# EasyEDA Pro project H7MS-native-official-library-audit-20261017.epro, schematic H7MS_CORE_H735_A1_核心板原理图, sheets 1 to 4 of 8

## Sheets
1 C01A_H735主控与信号分配: Assembly Variant: Basic; Board Name: Board1; Create Date: 2026-08-30; Page Name: P1; Project Name: H7MS-Core-A1; Schematic Name: Schematic1; Update Date: 2026-08-30; Company: 嘉立创EDA; Page Size: A3; Version: Draft_0.10
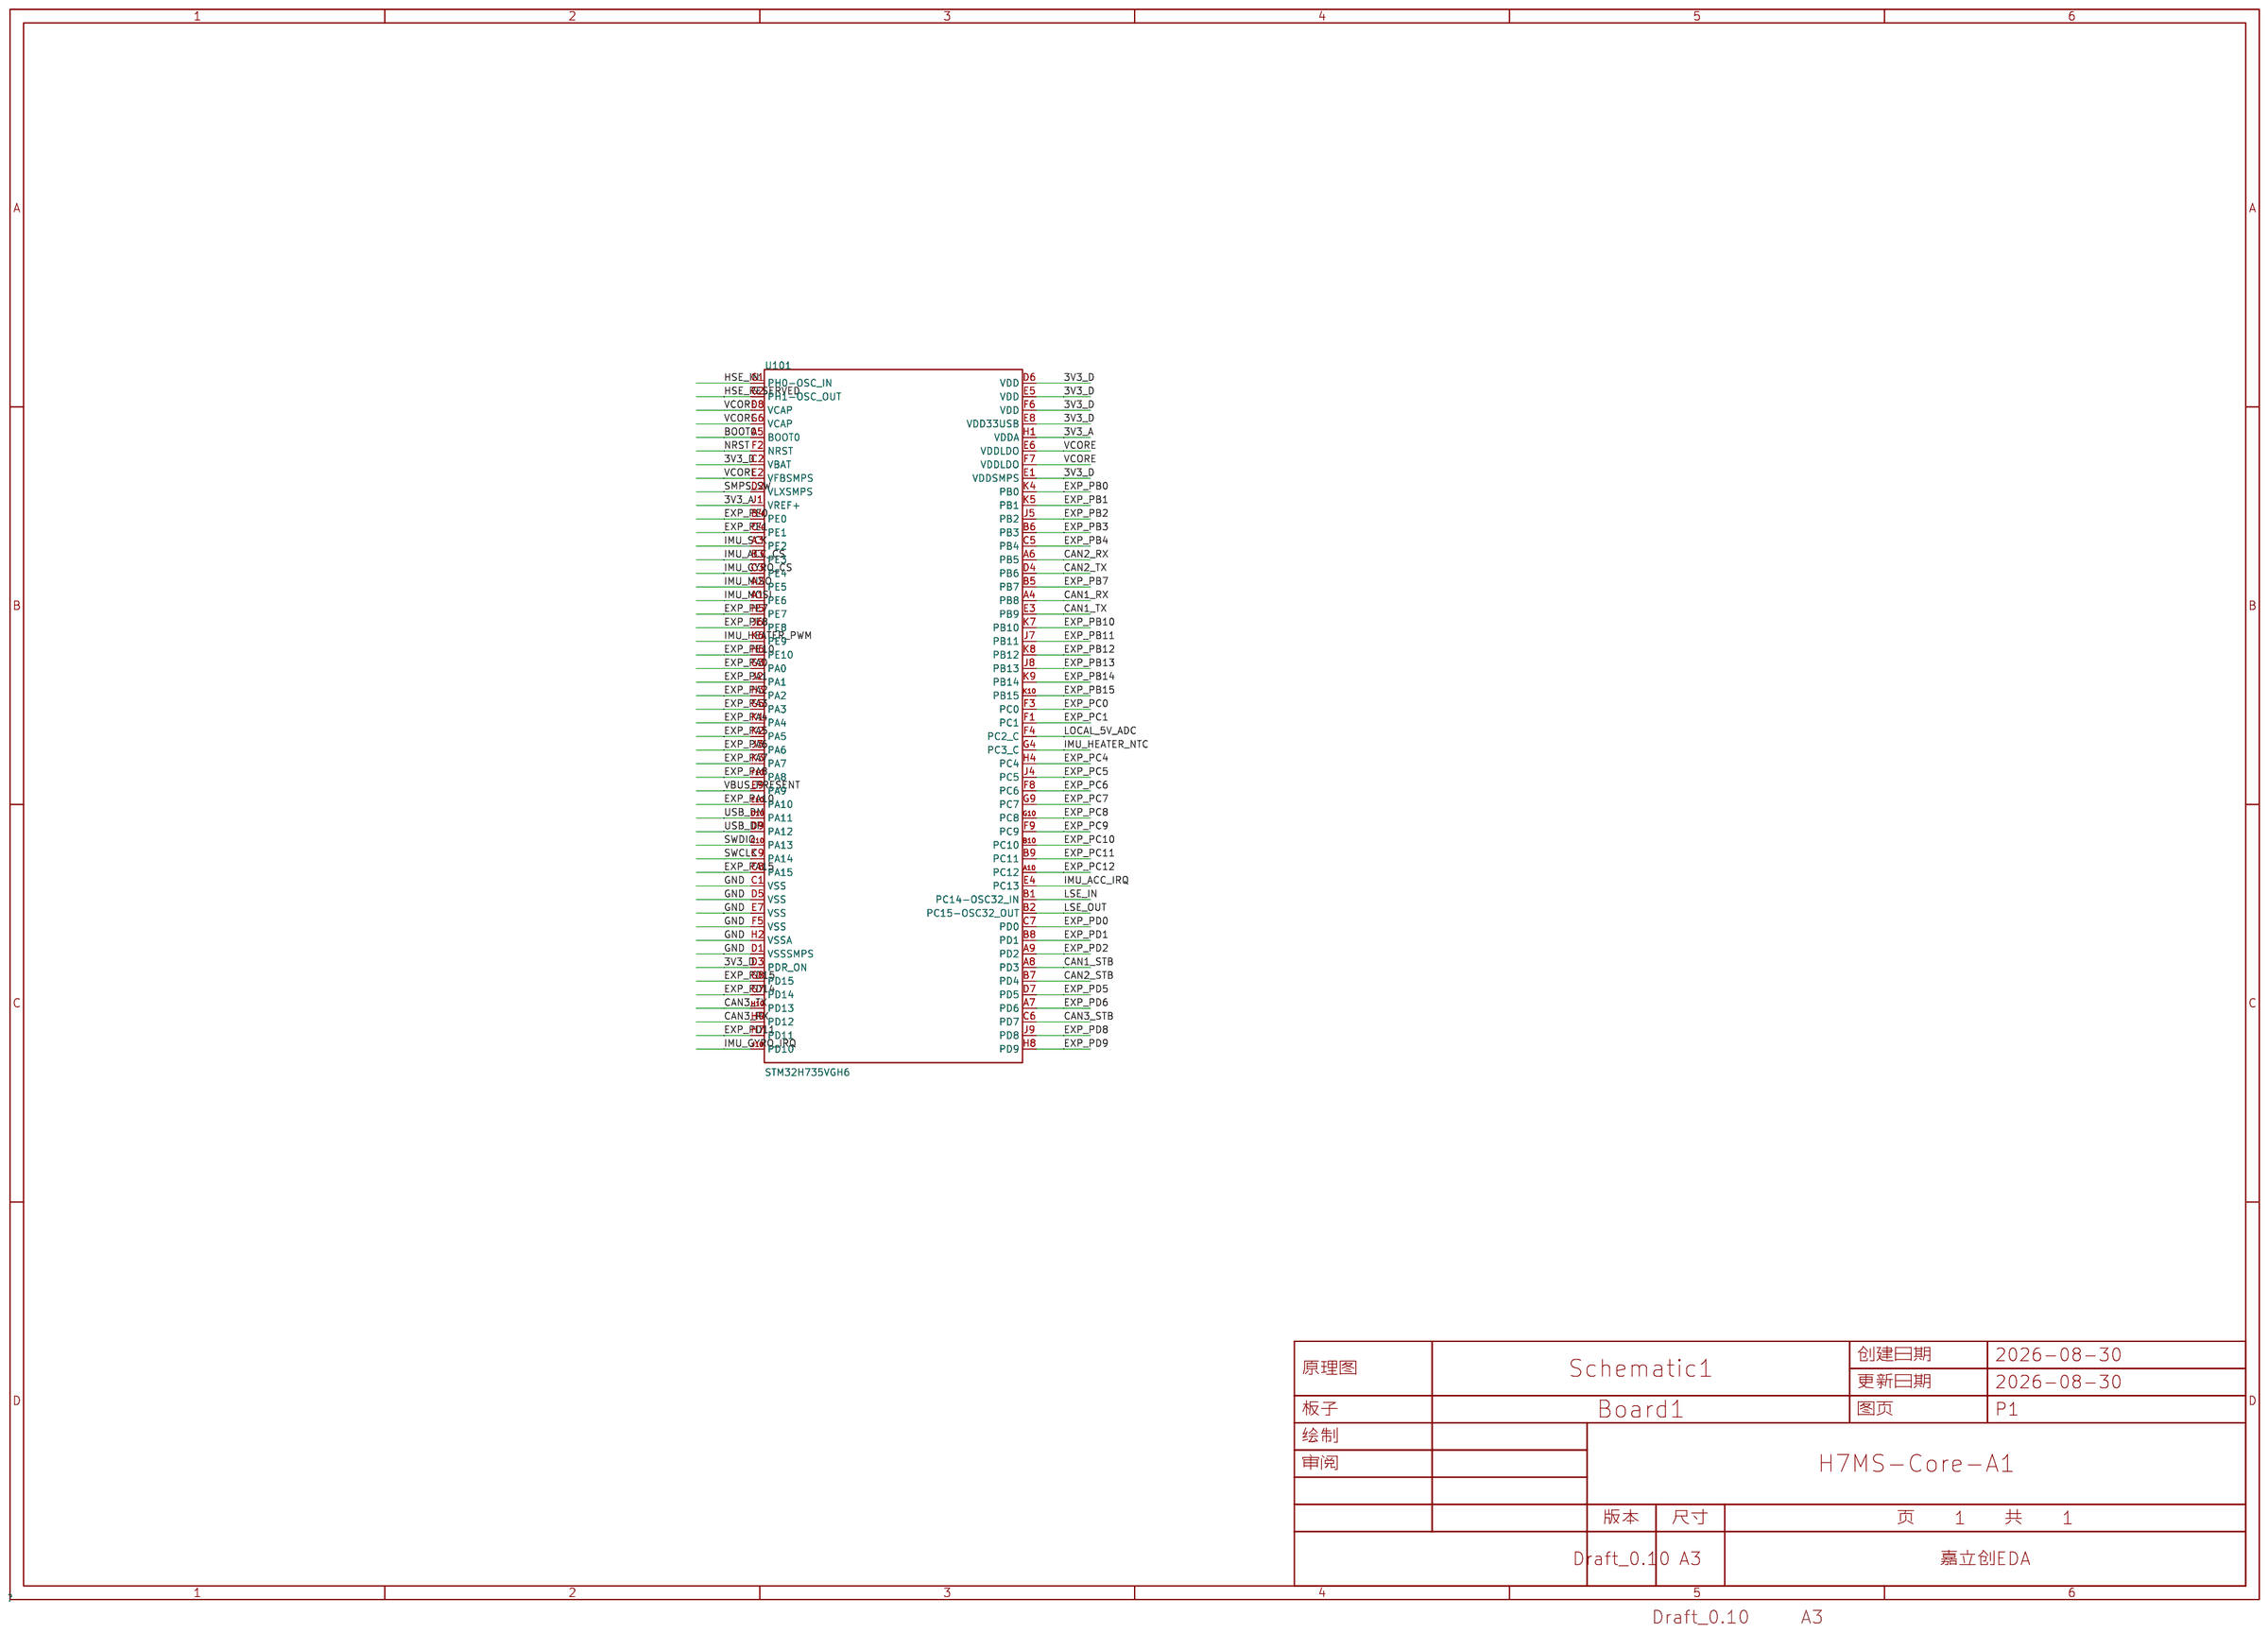
[diagram p0: C01A_H735主控与信号分配]
2 C01B_主控SMPS与电源去耦: Create Date: 2026-10-17; Update Date: 2026-10-17
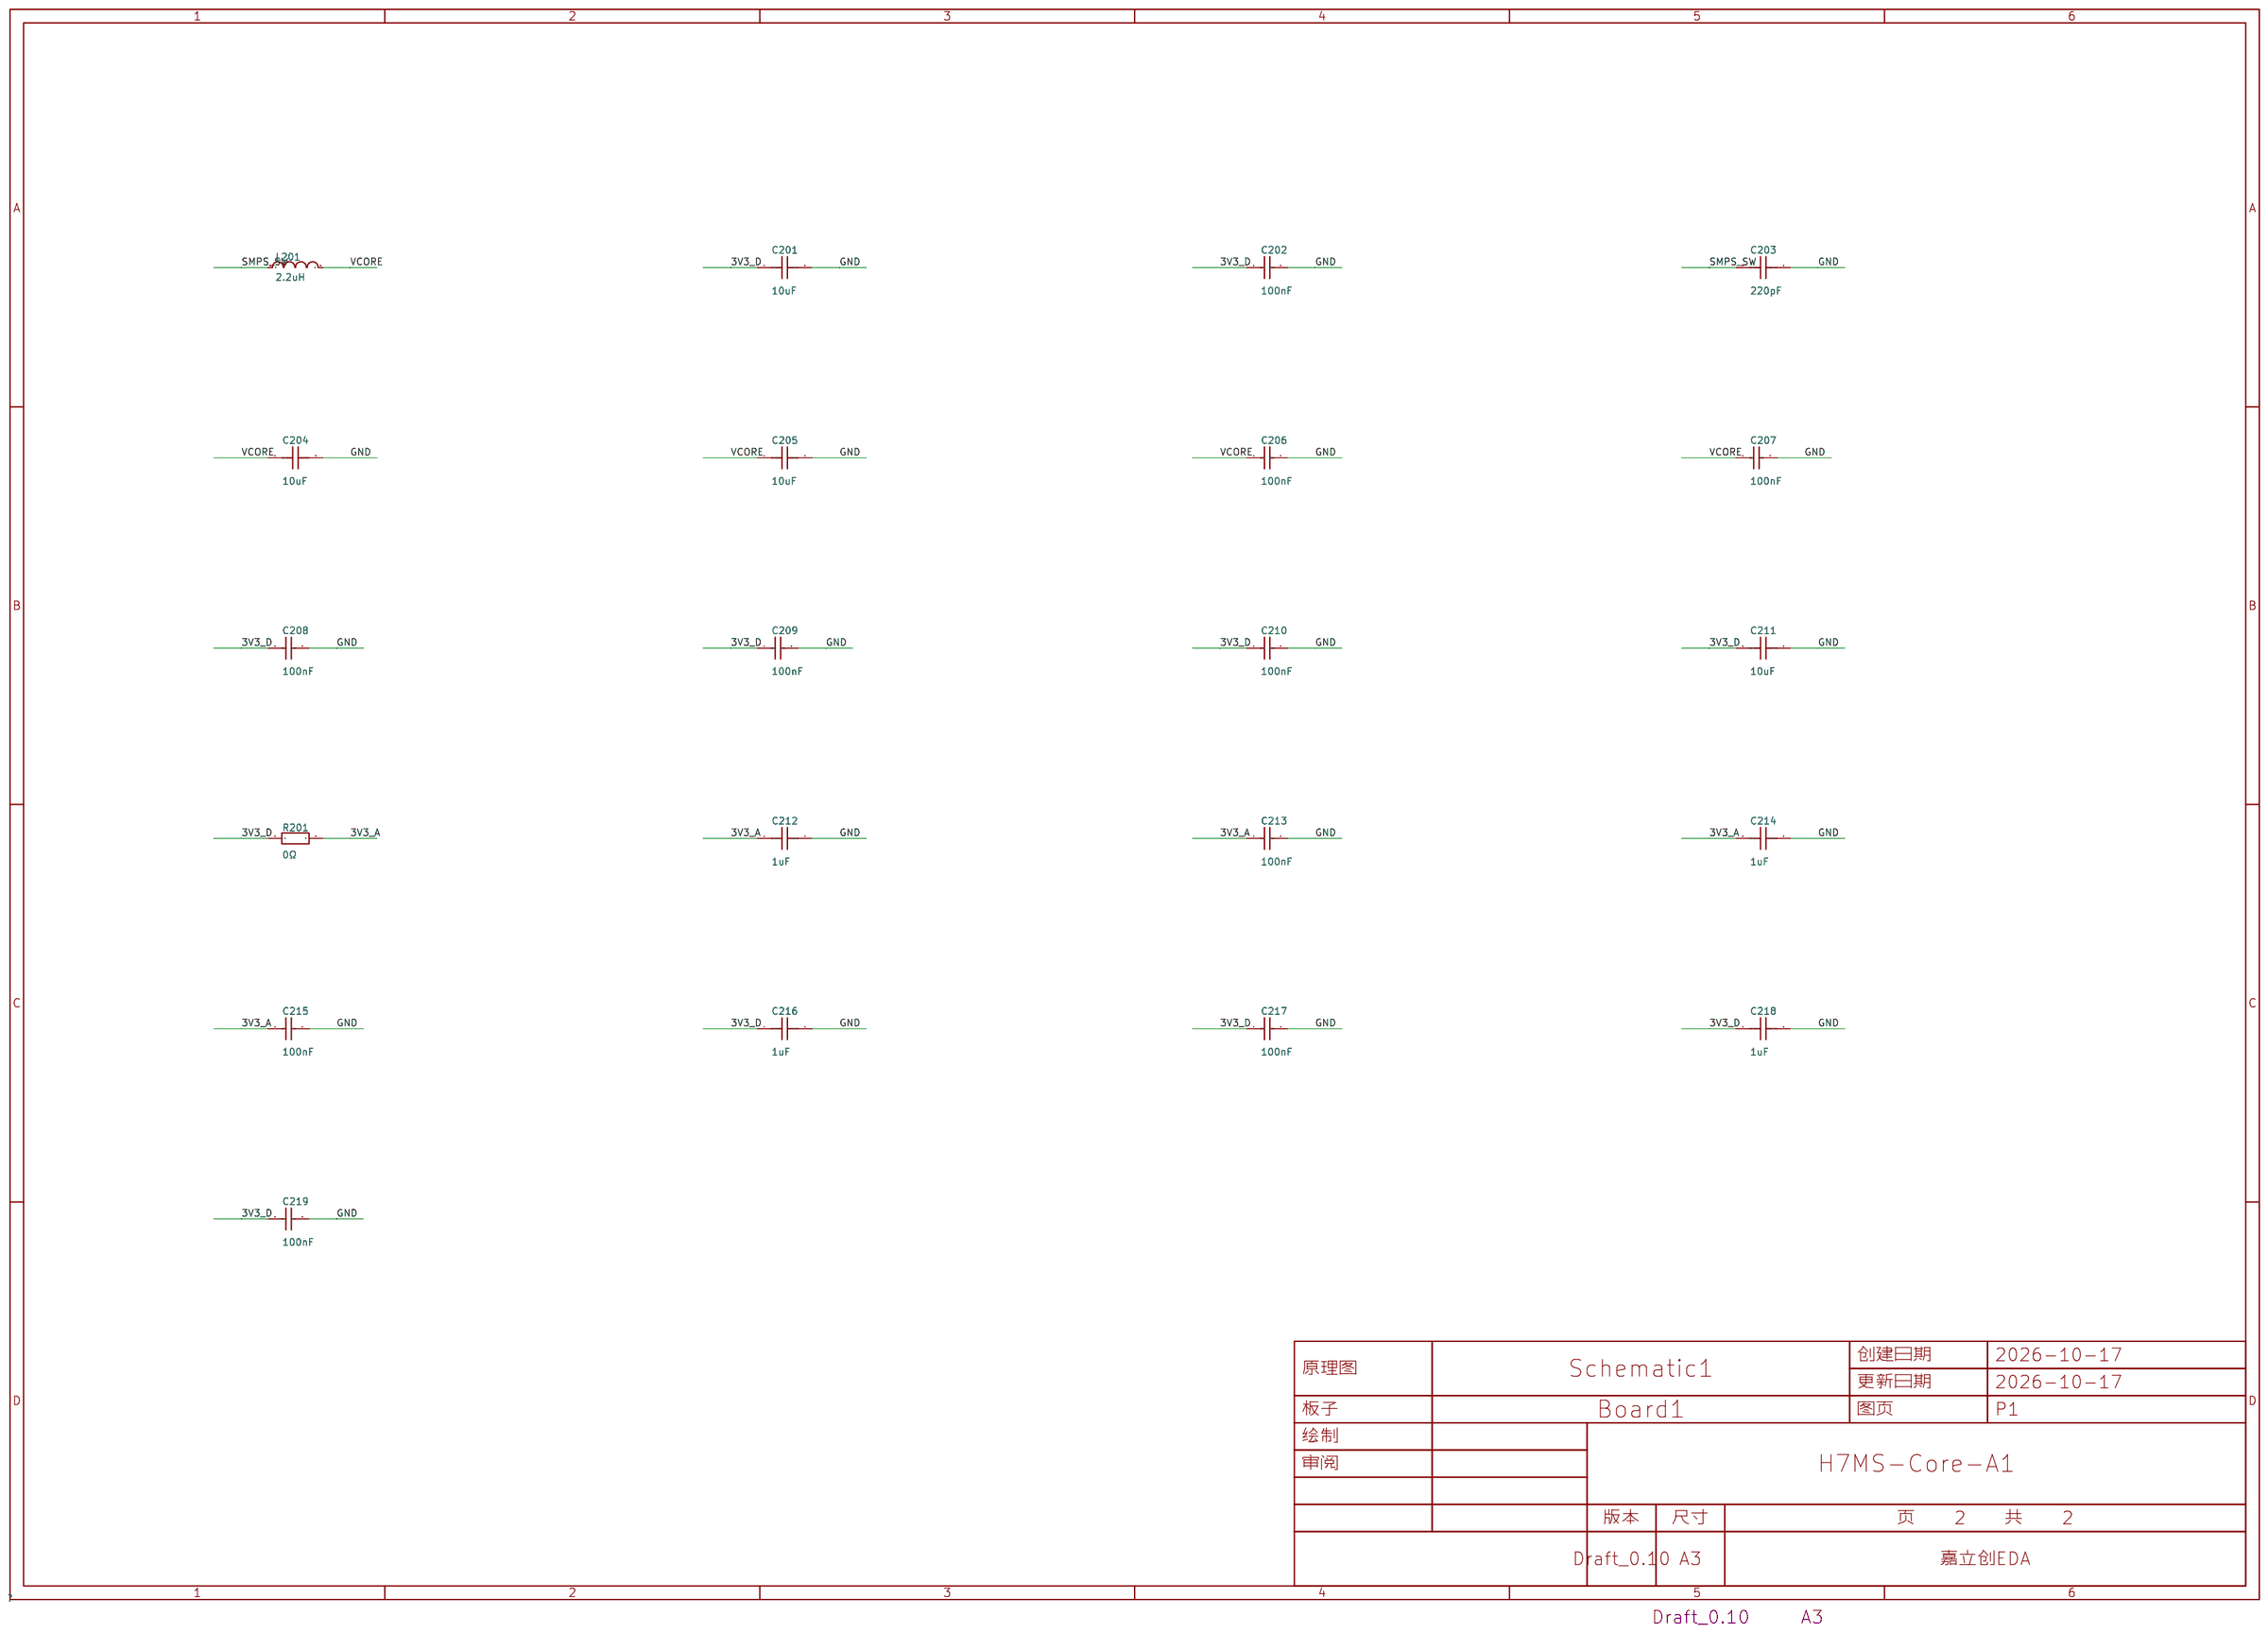
[diagram p1: C01B_主控SMPS与电源去耦]
3 C02_3V3降压与扩展电源保护: Create Date: 2026-10-17; Update Date: 2026-10-17
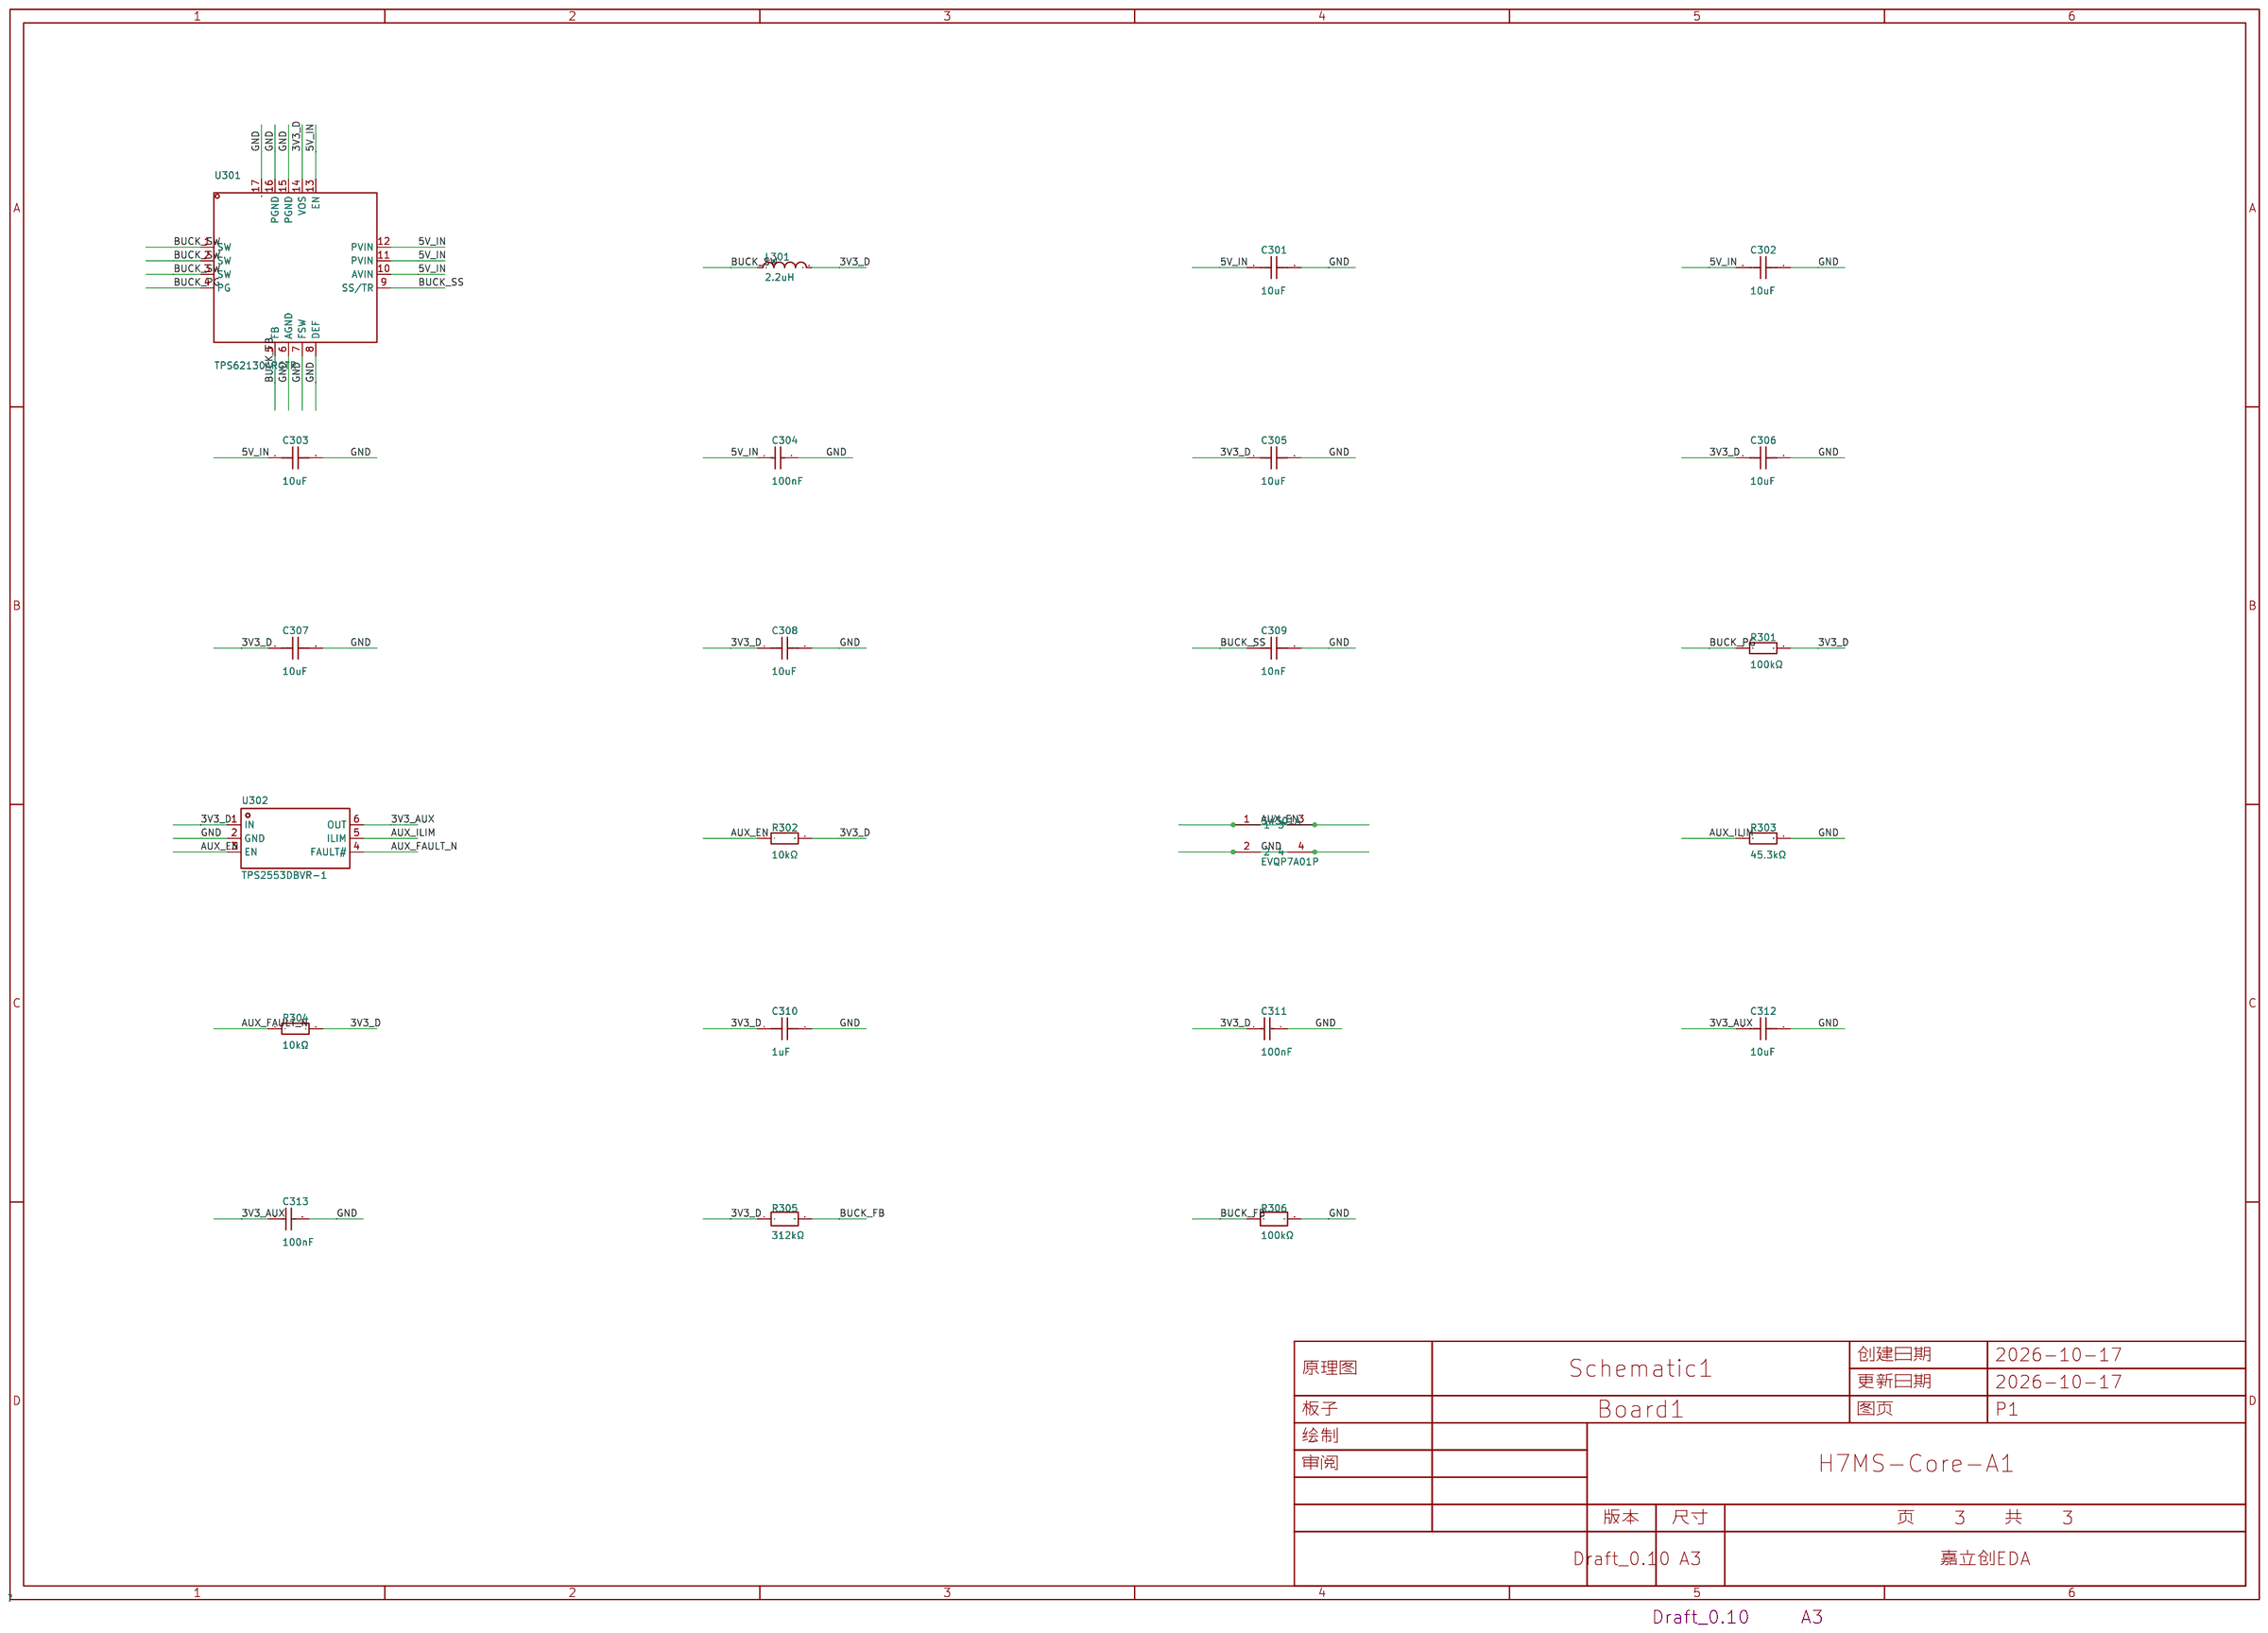
[diagram p2: C02_3V3降压与扩展电源保护]
4 C03_时钟复位启动与SWD: Create Date: 2026-10-17; Update Date: 2026-10-17
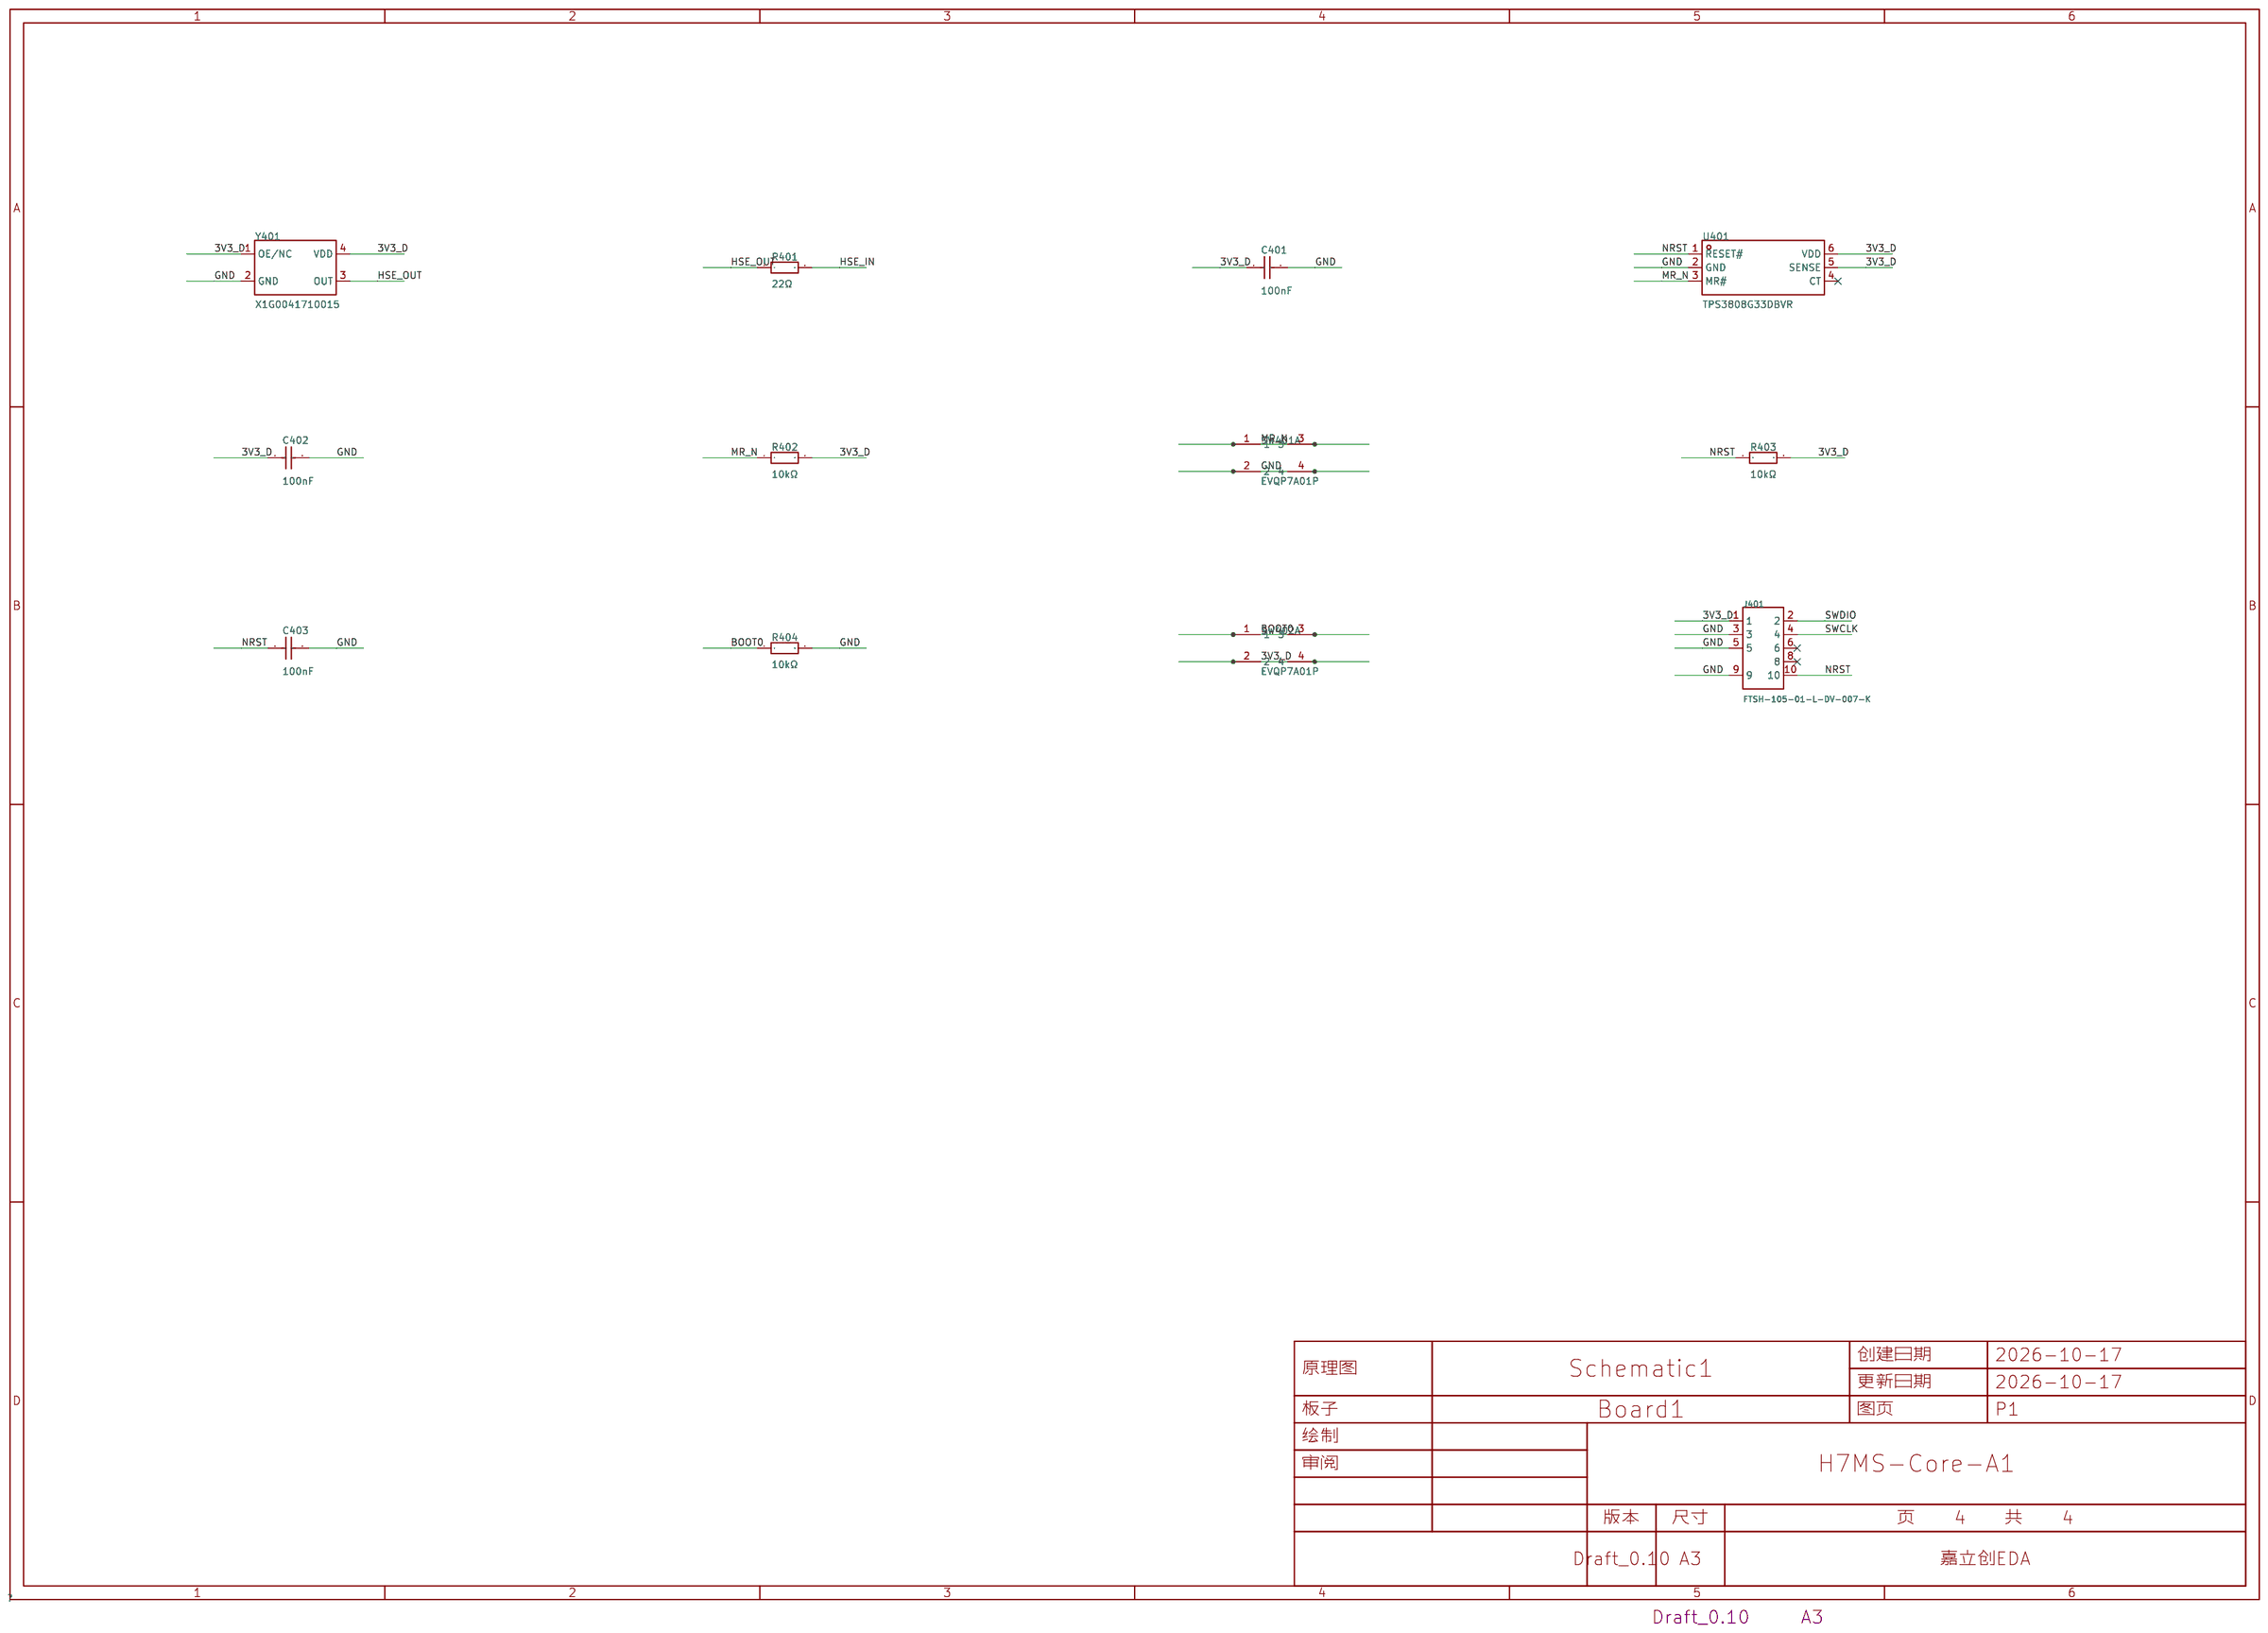
[diagram p3: C03_时钟复位启动与SWD]

## Parts
sheet C01A_H735主控与信号分配
U101  STM32H735VGH6  [BGA-100_L8.0-W8.0-P0.80-R10-C10-BL]
sheet C01B_主控SMPS与电源去耦
C201  10uF  [C0805]
C202  100nF  [C0402]
C203  220pF  [C0402]
C204  10uF  [C0805]
C205  10uF  [C0805]
C206  100nF  [C0402]
C207  100nF  [C0402]
C208  100nF  [C0402]
C209  100nF  [C0402]
C210  100nF  [C0402]
C211  10uF  [C0805]
C212  1uF  [C0603]
C213  100nF  [C0402]
C214  1uF  [C0603]
C215  100nF  [C0402]
C216  1uF  [C0603]
C217  100nF  [C0402]
C218  1uF  [C0603]
C219  100nF  [C0402]
L201  2.2uH  [IND-SMD_L2.5-W2.0-1]
R201  0Ω  [R0805]
sheet C02_3V3降压与扩展电源保护
C301  10uF  [C0805]
C302  10uF  [C0805]
C303  10uF  [C0805]
C304  100nF  [C0402]
C305  10uF  [C0805]
C306  10uF  [C0805]
C307  10uF  [C0805]
C308  10uF  [C0805]
C309  10nF  [C0402]
C310  1uF  [C0603]
C311  100nF  [C0402]
C312  10uF  [C0805]
C313  100nF  [C0402]
L301  2.2uH  [IND-SMD_L4.0-W4.0_XAL4030-332MEC]
R301  100kΩ  [R0402]
R302  10kΩ  [R0402]
R303  45.3kΩ  [R0402]
R304  10kΩ  [R0402]
R305  312kΩ  [R0603]
R306  100kΩ  [R0402]
SW301  EVQP7A01P  [H7MS_EVQP7A01P_1234]  (section 1)
U301  TPS62130ARGTR  [VQFN-16_L3.0-W3.0-P0.50-BL-EP1.7]
U302  TPS2553DBVR-1  [SOT-23-6_L2.9-W1.6-P0.95-LS2.8-BL]
sheet C03_时钟复位启动与SWD
C401  100nF  [C0402]
C402  100nF  [C0402]
C403  100nF  [C0402]
J401  FTSH-105-01-L-DV-007-K  [HDR-SMD_9P-P1.27_FTSH-105-01-L-DV-007-K]
R401  22Ω  [R0402]
R402  10kΩ  [R0402]
R403  10kΩ  [R0402]
R404  10kΩ  [R0402]
SW401  EVQP7A01P  [H7MS_EVQP7A01P_1234]  (section 1)
SW402  EVQP7A01P  [H7MS_EVQP7A01P_1234]  (section 1)
U401  TPS3808G33DBVR  [SOT-23-6_L2.9-W1.6-P0.95-LS2.8-BR]
Y401  X1G0041710015  [OSC-SMD_4P-L2.5-W2.0-BL]

## Library data of the parts
U101 = STM32H735VGH6: CPU内核:ARM Cortex-M7;CPU最大主频:550MHz;CPU位数:32 Bit;; LCSC Part Name: 高性能和带 DP-FPU 的 DSP、配备 1 MByte 闪存和 564 KBytes RAM 的 Arm Cortex-M7 微控制器、550 MHz CPU、L1 缓存、外部内存接口、SMPS、包括加密加速器在内的外围设备子集; Supplier Part: C5271179; Manufacturer: ST(意法半导体); Supplier Footprint: TFBGA-100(8x8); JLCPCB Part Class: Extended Part; Datasheet: https://item.szlcsc.com/datasheet/STM32H735VGH6/5997904.html; Supplier: LCSC; CPU Core: ARM Cortex-M7; CPU Maximum Speed: 550MHz; Core Size: 32 Bit; Program Storage Size: 1MB; Program Memory Type: FLASH; RAM Size: 560KB; Number of I/O: 74; Oscillator Type: 内置+外置; Voltage - Supply: 1.62V~3.6V; Operating Temperature: -40℃~+85℃; Function: U1; H7MS_Function: U1
C201 = GRM21BR61E106KA73L: 容值:10uF;精度:±10%;额定电压:25V;温度系数:X5R;; LCSC Part Name: 10uF ±10% 25V; Supplier Part: C84416; Manufacturer: muRata(村田); Supplier Footprint: 0805; JLCPCB Part Class: Extended Part; Datasheet: https://item.szlcsc.com/datasheet/GRM21BR61E106KA73L/85586.html; Supplier: LCSC; Tolerance: ±10%; Voltage Rating: 25V; Temperature Coefficient: X5R; H7MS_Function: C_SMPS_IN
C202 = C1005X7R1H104K050BB: 容值:100nF;精度:±10%;额定电压:50V;温度系数:X7R;; LCSC Part Name: 100nF ±10% 50V; Supplier Part: C2181015; Manufacturer: TDK; Supplier Footprint: 0402; JLCPCB Part Class: Extended Part; Datasheet: https://item.szlcsc.com/datasheet/C1005X7R1H104K050BB/2273082.html; Supplier: LCSC; Tolerance: ±10%; Voltage Rating: 50V; Temperature Coefficient: X7R; H7MS_Function: C_SMPS_HF
C203 = GRM1555C1H221JA01D: 容值:220pF;精度:±5%;额定电压:50V;温度系数:C0G;; LCSC Part Name: 220pF ±5% 50V; Supplier Part: C71693; Manufacturer: muRata(村田); Supplier Footprint: 0402; JLCPCB Part Class: Extended Part; Datasheet: https://item.szlcsc.com/datasheet/GRM1555C1H221JA01D/72801.html; Supplier: LCSC; Tolerance: ±5%; Voltage Rating: 50V; Temperature Coefficient: C0G; H7MS_Function: C_SMPS_SW
C204 = GRM21BR61E106KA73L: 容值:10uF;精度:±10%;额定电压:25V;温度系数:X5R;; LCSC Part Name: 10uF ±10% 25V; Supplier Part: C84416; Manufacturer: muRata(村田); Supplier Footprint: 0805; JLCPCB Part Class: Extended Part; Datasheet: https://item.szlcsc.com/datasheet/GRM21BR61E106KA73L/85586.html; Supplier: LCSC; Tolerance: ±10%; Voltage Rating: 25V; Temperature Coefficient: X5R; H7MS_Function: C_VCORE1
C205 = GRM21BR61E106KA73L: 容值:10uF;精度:±10%;额定电压:25V;温度系数:X5R;; LCSC Part Name: 10uF ±10% 25V; Supplier Part: C84416; Manufacturer: muRata(村田); Supplier Footprint: 0805; JLCPCB Part Class: Extended Part; Datasheet: https://item.szlcsc.com/datasheet/GRM21BR61E106KA73L/85586.html; Supplier: LCSC; Tolerance: ±10%; Voltage Rating: 25V; Temperature Coefficient: X5R; H7MS_Function: C_VCORE2
C206 = C1005X7R1H104K050BB: 容值:100nF;精度:±10%;额定电压:50V;温度系数:X7R;; LCSC Part Name: 100nF ±10% 50V; Supplier Part: C2181015; Manufacturer: TDK; Supplier Footprint: 0402; JLCPCB Part Class: Extended Part; Datasheet: https://item.szlcsc.com/datasheet/C1005X7R1H104K050BB/2273082.html; Supplier: LCSC; Tolerance: ±10%; Voltage Rating: 50V; Temperature Coefficient: X7R; H7MS_Function: C_VCAP_D8
C207 = C1005X7R1H104K050BB: 容值:100nF;精度:±10%;额定电压:50V;温度系数:X7R;; LCSC Part Name: 100nF ±10% 50V; Supplier Part: C2181015; Manufacturer: TDK; Supplier Footprint: 0402; JLCPCB Part Class: Extended Part; Datasheet: https://item.szlcsc.com/datasheet/C1005X7R1H104K050BB/2273082.html; Supplier: LCSC; Tolerance: ±10%; Voltage Rating: 50V; Temperature Coefficient: X7R; H7MS_Function: C_VCAP_G6
C208 = C1005X7R1H104K050BB: 容值:100nF;精度:±10%;额定电压:50V;温度系数:X7R;; LCSC Part Name: 100nF ±10% 50V; Supplier Part: C2181015; Manufacturer: TDK; Supplier Footprint: 0402; JLCPCB Part Class: Extended Part; Datasheet: https://item.szlcsc.com/datasheet/C1005X7R1H104K050BB/2273082.html; Supplier: LCSC; Tolerance: ±10%; Voltage Rating: 50V; Temperature Coefficient: X7R; H7MS_Function: C_VDD_D6
C209 = C1005X7R1H104K050BB: 容值:100nF;精度:±10%;额定电压:50V;温度系数:X7R;; LCSC Part Name: 100nF ±10% 50V; Supplier Part: C2181015; Manufacturer: TDK; Supplier Footprint: 0402; JLCPCB Part Class: Extended Part; Datasheet: https://item.szlcsc.com/datasheet/C1005X7R1H104K050BB/2273082.html; Supplier: LCSC; Tolerance: ±10%; Voltage Rating: 50V; Temperature Coefficient: X7R; H7MS_Function: C_VDD_E5
C210 = C1005X7R1H104K050BB: 容值:100nF;精度:±10%;额定电压:50V;温度系数:X7R;; LCSC Part Name: 100nF ±10% 50V; Supplier Part: C2181015; Manufacturer: TDK; Supplier Footprint: 0402; JLCPCB Part Class: Extended Part; Datasheet: https://item.szlcsc.com/datasheet/C1005X7R1H104K050BB/2273082.html; Supplier: LCSC; Tolerance: ±10%; Voltage Rating: 50V; Temperature Coefficient: X7R; H7MS_Function: C_VDD_F6
C211 = GRM21BR61E106KA73L: 容值:10uF;精度:±10%;额定电压:25V;温度系数:X5R;; LCSC Part Name: 10uF ±10% 25V; Supplier Part: C84416; Manufacturer: muRata(村田); Supplier Footprint: 0805; JLCPCB Part Class: Extended Part; Datasheet: https://item.szlcsc.com/datasheet/GRM21BR61E106KA73L/85586.html; Supplier: LCSC; Tolerance: ±10%; Voltage Rating: 25V; Temperature Coefficient: X5R; H7MS_Function: C_VDD_BULK
C212 = C1608X7R1C105K080AC: 容值:1uF;精度:±10%;额定电压:16V;温度系数:X7R;; LCSC Part Name: 1uF ±10% 16V; Supplier Part: C2167399; Manufacturer: TDK; Supplier Footprint: 0603; JLCPCB Part Class: Extended Part; Datasheet: https://item.szlcsc.com/datasheet/C1608X7R1C105K080AC/2259451.html; Supplier: LCSC; Tolerance: ±10%; Voltage Rating: 16V; Temperature Coefficient: X7R; H7MS_Function: C_VDDA_BULK
C213 = C1005X7R1H104K050BB: 容值:100nF;精度:±10%;额定电压:50V;温度系数:X7R;; LCSC Part Name: 100nF ±10% 50V; Supplier Part: C2181015; Manufacturer: TDK; Supplier Footprint: 0402; JLCPCB Part Class: Extended Part; Datasheet: https://item.szlcsc.com/datasheet/C1005X7R1H104K050BB/2273082.html; Supplier: LCSC; Tolerance: ±10%; Voltage Rating: 50V; Temperature Coefficient: X7R; H7MS_Function: C_VDDA_HF
C214 = C1608X7R1C105K080AC: 容值:1uF;精度:±10%;额定电压:16V;温度系数:X7R;; LCSC Part Name: 1uF ±10% 16V; Supplier Part: C2167399; Manufacturer: TDK; Supplier Footprint: 0603; JLCPCB Part Class: Extended Part; Datasheet: https://item.szlcsc.com/datasheet/C1608X7R1C105K080AC/2259451.html; Supplier: LCSC; Tolerance: ±10%; Voltage Rating: 16V; Temperature Coefficient: X7R; H7MS_Function: C_VREF_BULK
C215 = C1005X7R1H104K050BB: 容值:100nF;精度:±10%;额定电压:50V;温度系数:X7R;; LCSC Part Name: 100nF ±10% 50V; Supplier Part: C2181015; Manufacturer: TDK; Supplier Footprint: 0402; JLCPCB Part Class: Extended Part; Datasheet: https://item.szlcsc.com/datasheet/C1005X7R1H104K050BB/2273082.html; Supplier: LCSC; Tolerance: ±10%; Voltage Rating: 50V; Temperature Coefficient: X7R; H7MS_Function: C_VREF_HF
C216 = C1608X7R1C105K080AC: 容值:1uF;精度:±10%;额定电压:16V;温度系数:X7R;; LCSC Part Name: 1uF ±10% 16V; Supplier Part: C2167399; Manufacturer: TDK; Supplier Footprint: 0603; JLCPCB Part Class: Extended Part; Datasheet: https://item.szlcsc.com/datasheet/C1608X7R1C105K080AC/2259451.html; Supplier: LCSC; Tolerance: ±10%; Voltage Rating: 16V; Temperature Coefficient: X7R; H7MS_Function: C_USB_BULK
C217 = C1005X7R1H104K050BB: 容值:100nF;精度:±10%;额定电压:50V;温度系数:X7R;; LCSC Part Name: 100nF ±10% 50V; Supplier Part: C2181015; Manufacturer: TDK; Supplier Footprint: 0402; JLCPCB Part Class: Extended Part; Datasheet: https://item.szlcsc.com/datasheet/C1005X7R1H104K050BB/2273082.html; Supplier: LCSC; Tolerance: ±10%; Voltage Rating: 50V; Temperature Coefficient: X7R; H7MS_Function: C_USB_HF
C218 = C1608X7R1C105K080AC: 容值:1uF;精度:±10%;额定电压:16V;温度系数:X7R;; LCSC Part Name: 1uF ±10% 16V; Supplier Part: C2167399; Manufacturer: TDK; Supplier Footprint: 0603; JLCPCB Part Class: Extended Part; Datasheet: https://item.szlcsc.com/datasheet/C1608X7R1C105K080AC/2259451.html; Supplier: LCSC; Tolerance: ±10%; Voltage Rating: 16V; Temperature Coefficient: X7R; H7MS_Function: C_VBAT_BULK
C219 = C1005X7R1H104K050BB: 容值:100nF;精度:±10%;额定电压:50V;温度系数:X7R;; LCSC Part Name: 100nF ±10% 50V; Supplier Part: C2181015; Manufacturer: TDK; Supplier Footprint: 0402; JLCPCB Part Class: Extended Part; Datasheet: https://item.szlcsc.com/datasheet/C1005X7R1H104K050BB/2273082.html; Supplier: LCSC; Tolerance: ±10%; Voltage Rating: 50V; Temperature Coefficient: X7R; H7MS_Function: C_VBAT_HF
L201 = VLS252012HBX-2R2M-1: 电感值:2.2uH;精度:±20%;额定电流:2.04A;饱和电流(Isat):2.04A;类型:-;; LCSC Part Name: 2.2uH ±20% 2.04A; Supplier Part: C88535; Manufacturer: TDK; Supplier Footprint: 1008; JLCPCB Part Class: Extended Part; Datasheet: https://atta.szlcsc.com/upload/public/pdf/source/20180629/C88535_D29F4F5330AC049E01BE88F05575ED20.pdf; Supplier: LCSC; Tolerance: ±20%; Rated Current: 2.04A; Saturation Current (Isat): 2.04A; DC Resistance (DCR): 102mΩ; H7MS_Function: L1
R201 = RC0805JR-070RL: 电阻类型:厚膜电阻;阻值:0Ω;精度:±5%;功率:125mW;工作电压:150V;温度系数:-;; LCSC Part Name: 厚膜电阻 0Ω ±5% 125mW; Supplier Part: C96345; Manufacturer: YAGEO(国巨); Supplier Footprint: 0805; JLCPCB Part Class: Extended Part; Datasheet: https://item.szlcsc.com/datasheet/RC0805JR-070RL/97549.html; Supplier: LCSC; Type: 厚膜电阻; Tolerance: ±5%; Power(Watts): 125mW; Voltage-Supply(Max): 150V; Operating Temperature: -55℃~+155℃; H7MS_Function: R_ANALOG
C301 = GRM21BR61E106KA73L: 容值:10uF;精度:±10%;额定电压:25V;温度系数:X5R;; LCSC Part Name: 10uF ±10% 25V; Supplier Part: C84416; Manufacturer: muRata(村田); Supplier Footprint: 0805; JLCPCB Part Class: Extended Part; Datasheet: https://item.szlcsc.com/datasheet/GRM21BR61E106KA73L/85586.html; Supplier: LCSC; Tolerance: ±10%; Voltage Rating: 25V; Temperature Coefficient: X5R; H7MS_Function: C_BUCK_IN
C302 = GRM21BR61E106KA73L: 容值:10uF;精度:±10%;额定电压:25V;温度系数:X5R;; LCSC Part Name: 10uF ±10% 25V; Supplier Part: C84416; Manufacturer: muRata(村田); Supplier Footprint: 0805; JLCPCB Part Class: Extended Part; Datasheet: https://item.szlcsc.com/datasheet/GRM21BR61E106KA73L/85586.html; Supplier: LCSC; Tolerance: ±10%; Voltage Rating: 25V; Temperature Coefficient: X5R; H7MS_Function: C_BUCK_IN2
C303 = GRM21BR61E106KA73L: 容值:10uF;精度:±10%;额定电压:25V;温度系数:X5R;; LCSC Part Name: 10uF ±10% 25V; Supplier Part: C84416; Manufacturer: muRata(村田); Supplier Footprint: 0805; JLCPCB Part Class: Extended Part; Datasheet: https://item.szlcsc.com/datasheet/GRM21BR61E106KA73L/85586.html; Supplier: LCSC; Tolerance: ±10%; Voltage Rating: 25V; Temperature Coefficient: X5R; H7MS_Function: C_BUCK_IN3
C304 = C1005X7R1H104K050BB: 容值:100nF;精度:±10%;额定电压:50V;温度系数:X7R;; LCSC Part Name: 100nF ±10% 50V; Supplier Part: C2181015; Manufacturer: TDK; Supplier Footprint: 0402; JLCPCB Part Class: Extended Part; Datasheet: https://item.szlcsc.com/datasheet/C1005X7R1H104K050BB/2273082.html; Supplier: LCSC; Tolerance: ±10%; Voltage Rating: 50V; Temperature Coefficient: X7R; H7MS_Function: C_BUCK_HF
C305 = GRM21BR61E106KA73L: 容值:10uF;精度:±10%;额定电压:25V;温度系数:X5R;; LCSC Part Name: 10uF ±10% 25V; Supplier Part: C84416; Manufacturer: muRata(村田); Supplier Footprint: 0805; JLCPCB Part Class: Extended Part; Datasheet: https://item.szlcsc.com/datasheet/GRM21BR61E106KA73L/85586.html; Supplier: LCSC; Tolerance: ±10%; Voltage Rating: 25V; Temperature Coefficient: X5R; H7MS_Function: C_BUCK_OUT
C306 = GRM21BR61E106KA73L: 容值:10uF;精度:±10%;额定电压:25V;温度系数:X5R;; LCSC Part Name: 10uF ±10% 25V; Supplier Part: C84416; Manufacturer: muRata(村田); Supplier Footprint: 0805; JLCPCB Part Class: Extended Part; Datasheet: https://item.szlcsc.com/datasheet/GRM21BR61E106KA73L/85586.html; Supplier: LCSC; Tolerance: ±10%; Voltage Rating: 25V; Temperature Coefficient: X5R; H7MS_Function: C_BUCK_OUT2
C307 = GRM21BR61E106KA73L: 容值:10uF;精度:±10%;额定电压:25V;温度系数:X5R;; LCSC Part Name: 10uF ±10% 25V; Supplier Part: C84416; Manufacturer: muRata(村田); Supplier Footprint: 0805; JLCPCB Part Class: Extended Part; Datasheet: https://item.szlcsc.com/datasheet/GRM21BR61E106KA73L/85586.html; Supplier: LCSC; Tolerance: ±10%; Voltage Rating: 25V; Temperature Coefficient: X5R; H7MS_Function: C_BUCK_OUT3
C308 = GRM21BR61E106KA73L: 容值:10uF;精度:±10%;额定电压:25V;温度系数:X5R;; LCSC Part Name: 10uF ±10% 25V; Supplier Part: C84416; Manufacturer: muRata(村田); Supplier Footprint: 0805; JLCPCB Part Class: Extended Part; Datasheet: https://item.szlcsc.com/datasheet/GRM21BR61E106KA73L/85586.html; Supplier: LCSC; Tolerance: ±10%; Voltage Rating: 25V; Temperature Coefficient: X5R; H7MS_Function: C_BUCK_OUT4
C309 = GRM1555C1H103JE01D: 容值:10nF;精度:±5%;额定电压:50V;温度系数:C0G;; LCSC Part Name: 10nF ±5% 50V; Supplier Part: C22400107; Manufacturer: muRata(村田); Supplier Footprint: 0402; JLCPCB Part Class: Extended Part; Datasheet: https://atta.szlcsc.com/upload/public/pdf/source/20240516/4A564BD6D055E5006B75B6B7BBF3AC7F.pdf; Supplier: LCSC; Tolerance: ±5%; Voltage Rating: 50V; Temperature Coefficient: C0G; H7MS_Function: C_BUCK_SS
C310 = C1608X7R1C105K080AC: 容值:1uF;精度:±10%;额定电压:16V;温度系数:X7R;; LCSC Part Name: 1uF ±10% 16V; Supplier Part: C2167399; Manufacturer: TDK; Supplier Footprint: 0603; JLCPCB Part Class: Extended Part; Datasheet: https://item.szlcsc.com/datasheet/C1608X7R1C105K080AC/2259451.html; Supplier: LCSC; Tolerance: ±10%; Voltage Rating: 16V; Temperature Coefficient: X7R; H7MS_Function: C_AUX_IN
C311 = C1005X7R1H104K050BB: 容值:100nF;精度:±10%;额定电压:50V;温度系数:X7R;; LCSC Part Name: 100nF ±10% 50V; Supplier Part: C2181015; Manufacturer: TDK; Supplier Footprint: 0402; JLCPCB Part Class: Extended Part; Datasheet: https://item.szlcsc.com/datasheet/C1005X7R1H104K050BB/2273082.html; Supplier: LCSC; Tolerance: ±10%; Voltage Rating: 50V; Temperature Coefficient: X7R; H7MS_Function: C_AUX_IN_HF
C312 = GRM21BR61E106KA73L: 容值:10uF;精度:±10%;额定电压:25V;温度系数:X5R;; LCSC Part Name: 10uF ±10% 25V; Supplier Part: C84416; Manufacturer: muRata(村田); Supplier Footprint: 0805; JLCPCB Part Class: Extended Part; Datasheet: https://item.szlcsc.com/datasheet/GRM21BR61E106KA73L/85586.html; Supplier: LCSC; Tolerance: ±10%; Voltage Rating: 25V; Temperature Coefficient: X5R; H7MS_Function: C_AUX_OUT
C313 = C1005X7R1H104K050BB: 容值:100nF;精度:±10%;额定电压:50V;温度系数:X7R;; LCSC Part Name: 100nF ±10% 50V; Supplier Part: C2181015; Manufacturer: TDK; Supplier Footprint: 0402; JLCPCB Part Class: Extended Part; Datasheet: https://item.szlcsc.com/datasheet/C1005X7R1H104K050BB/2273082.html; Supplier: LCSC; Tolerance: ±10%; Voltage Rating: 50V; Temperature Coefficient: X7R; H7MS_Function: C_AUX_OUT_HF
L301 = XFL4020-222MEC_C122469: 电感值:2.2uH;精度:±20%;额定电流:8A;饱和电流(Isat):3.7A;; LCSC Part Name: 2.2uH ±20% 3.7A; Supplier Part: C122469; Manufacturer: Coilcraft(线艺); Manufacturer Part: XFL4020-222MEC; Supplier Footprint: SMD,4x4mm; JLCPCB Part Class: Extended Part; Datasheet: https://www.coilcraft.com/getmedia/50632d43-da1b-4cdb-8ab4-3029cab51df3/xfl4020.pdf; Supplier: LCSC; Tolerance: ±20%; Current Rating: 8A; Current - Saturation(Isat): 3.7A; DC Resistance(DCR): 21.35mΩ; H7MS_Function: L2
R301 = RC0402FR-07100KL: 电阻类型:厚膜电阻;阻值:100kΩ;精度:±1%;功率:62.5mW;工作电压:50V;温度系数:±100ppm/℃;; LCSC Part Name: 厚膜电阻 100kΩ ±1% 62.5mW; Supplier Part: C60491; Manufacturer: YAGEO(国巨); Supplier Footprint: 0402; JLCPCB Part Class: Extended Part; Datasheet: https://item.szlcsc.com/datasheet/RC0402FR-07100KL/61543.html; Supplier: LCSC; Type: 厚膜电阻; Tolerance: ±1%; Power(Watts): 62.5mW; Voltage-Supply(Max): 50V; Temperature Coefficient: ±100ppm/℃; Operating Temperature: -55℃~+155℃; H7MS_Function: R_BUCK_PG
R302 = RC0402FR-0710KL: 电阻类型:厚膜电阻;阻值:10kΩ;精度:±1%;功率:62.5mW;工作电压:50V;温度系数:±100ppm/℃;; LCSC Part Name: 厚膜电阻 10kΩ ±1% 62.5mW; Supplier Part: C60490; Manufacturer: YAGEO(国巨); Supplier Footprint: 0402; JLCPCB Part Class: Extended Part; Datasheet: https://item.szlcsc.com/datasheet/RC0402FR-0710KL/61542.html; Supplier: LCSC; Type: 厚膜电阻; Tolerance: ±1%; Power(Watts): 62.5mW; Voltage-Supply(Max): 50V; Temperature Coefficient: ±100ppm/℃; Operating Temperature: -55℃~+155℃; H7MS_Function: R_AUX_EN
R303 = RC0402FR-0745K3L: 电阻类型:厚膜电阻;阻值:45.3kΩ;精度:±1%;功率:62.5mW;工作电压:50V;温度系数:±100ppm/℃;; LCSC Part Name: 厚膜电阻 45.3kΩ ±1% 62.5mW; Supplier Part: C137977; Manufacturer: YAGEO(国巨); Supplier Footprint: 0402; JLCPCB Part Class: Extended Part; Datasheet: https://item.szlcsc.com/datasheet/RC0402FR-0745K3L/149293.html; Supplier: LCSC; Type: 厚膜电阻; Tolerance: ±1%; Power(Watts): 62.5mW; Voltage-Supply(Max): 50V; Temperature Coefficient: ±100ppm/℃; Operating Temperature: -55℃~+155℃; H7MS_Function: R_AUX_ILIM
R304 = RC0402FR-0710KL: 电阻类型:厚膜电阻;阻值:10kΩ;精度:±1%;功率:62.5mW;工作电压:50V;温度系数:±100ppm/℃;; LCSC Part Name: 厚膜电阻 10kΩ ±1% 62.5mW; Supplier Part: C60490; Manufacturer: YAGEO(国巨); Supplier Footprint: 0402; JLCPCB Part Class: Extended Part; Datasheet: https://item.szlcsc.com/datasheet/RC0402FR-0710KL/61542.html; Supplier: LCSC; Type: 厚膜电阻; Tolerance: ±1%; Power(Watts): 62.5mW; Voltage-Supply(Max): 50V; Temperature Coefficient: ±100ppm/℃; Operating Temperature: -55℃~+155℃; H7MS_Function: R_AUX_FAULT
R305 = RT0603BRD07312KL: 电阻类型:薄膜电阻;阻值:312kΩ;精度:±0.1%;功率:100mW;温度系数:±25ppm/℃;; LCSC Part Name: 薄膜电阻 312kΩ ±0.1% 100mW; Supplier Part: C861315; Manufacturer: YAGEO(国巨); Supplier Footprint: 0603; JLCPCB Part Class: Extended Part; Datasheet: https://item.szlcsc.com/datasheet/RT0603BRD07312KL/921653.html; Supplier: LCSC; Type: 薄膜电阻; Tolerance: ±0.1%; Power(Watts): 100mW; Temperature Coefficient: ±25ppm/℃; Operating Temperature: -55℃~+155℃; H7MS_Function: R_FB_TOP
R306 = RT0402BRD07100KL: 电阻类型:薄膜电阻;阻值:100kΩ;精度:±0.1%;功率:62.5mW;最大工作电压:50V;温度系数:±25ppm/℃;; LCSC Part Name: 薄膜电阻 100kΩ ±0.1% 62.5mW; Supplier Part: C852472; Manufacturer: YAGEO(国巨); Supplier Footprint: 0402; JLCPCB Part Class: Extended Part; Datasheet: https://atta.szlcsc.com/upload/public/pdf/source/20210326/C852472_6283D268A9C33EA67274729CC55E28B1.pdf; Supplier: LCSC; Type: 薄膜电阻; Tolerance: ±0.1%; Power(Watts): 62.5mW; Overload Voltage (Max): 50V; Temperature Coefficient: ±25ppm/℃; Operating Temperature Range: -55℃~+155℃; H7MS_Function: R_FB_BOT
SW301 = H7MS_EVQP7A01P_1234_Inward: Corrected numeric contact aliases; inward pin graphics.; Manufacturer: PANASONIC(松下); Supplier: LCSC; Supplier Part: C79167; LCSC Part Name: 3.5*3.55*1.35mm 卧贴 轻触开关; Supplier Footprint: SMD,3.5x3.6mm; JLCPCB Part Class: Extended Part; Datasheet: https://item.szlcsc.com/datasheet/EVQP7A01P/80304.html; Circuit: 单刀单掷; Actuator Style: 矩形按钮; Operating Force: 2.2N; Mounting Type: 卧贴; Length: 3.5mm; Width: 3.55mm; Switch Height: 1.35mm; Contact Current: 50mA; Voltage Rating: 12V; Termination Style: 焊片; Life: 10万次; Operating Temperature: -20℃~+70℃; H7MS_Function: SW_AUX_RESET
U301 = TPS62130ARGTR: 功能类型:降压型;工作电压:3V~17V;输出电压:900mV~6V;输出电流:3A;输出类型:可调;; LCSC Part Name: 降压型 3A 3V~17V; Supplier Part: C337502; Manufacturer: TI(德州仪器); Supplier Footprint: QFN-16-EP(3x3); JLCPCB Part Class: Extended Part; Datasheet: https://www.ti.com/cn/lit/ds/symlink/tps62132.pdf; Supplier: LCSC; Function: 降压型; Voltage - Supply: 3V~17V; Output Voltage: 900mV~6V; Output Current: 3A; Frequency - Switching: 2.5MHz; Operating Temperature: -40℃~+85℃@(TA); Synchronous Rectifier: 是; Number of Outputs: 1; Topology: 降压式; Quiescent Current: 17uA; Switch tube (built-in/external): 内置; Output Type: 可调; Features: 轻载高效模式；可调软启动；过流保护；输出电压跟随；工作状态指示; H7MS_Function: U2
U302 = TPS2553DBVR-1: 类型:高侧开关;通道数:1;输入控制逻辑:高电平有效;工作电压:2.5V~6.5V;最大连续电流:1.5A;导通电阻:85mΩ;; LCSC Part Name: 精密可调、带电流限制的电源分配开关; Supplier Part: C111738; Manufacturer: TI(德州仪器); Supplier Footprint: SOT-23-6; JLCPCB Part Class: Extended Part; Datasheet: https://www.ti.com/cn/lit/ds/symlink/tps2553-1.pdf; Supplier: LCSC; Type: 高侧开关; Number of Channels: 1; Control Input Logic: 高电平有效; Voltage - Supply: 2.5V~6.5V; Maximum Continuous Current: 1.5A; RDS(on): 85mΩ; Features: 过温保护；过流保护；短路保护；过压保护；集成电荷泵；反向电压保护；反向电流阻断；软启动；锁存保护；欠压锁定; Operating Temperature	-: -40℃~+150℃; H7MS_Function: U_AUX
C401 = C1005X7R1H104K050BB: 容值:100nF;精度:±10%;额定电压:50V;温度系数:X7R;; LCSC Part Name: 100nF ±10% 50V; Supplier Part: C2181015; Manufacturer: TDK; Supplier Footprint: 0402; JLCPCB Part Class: Extended Part; Datasheet: https://item.szlcsc.com/datasheet/C1005X7R1H104K050BB/2273082.html; Supplier: LCSC; Tolerance: ±10%; Voltage Rating: 50V; Temperature Coefficient: X7R; H7MS_Function: C_HSE
C402 = C1005X7R1H104K050BB: 容值:100nF;精度:±10%;额定电压:50V;温度系数:X7R;; LCSC Part Name: 100nF ±10% 50V; Supplier Part: C2181015; Manufacturer: TDK; Supplier Footprint: 0402; JLCPCB Part Class: Extended Part; Datasheet: https://item.szlcsc.com/datasheet/C1005X7R1H104K050BB/2273082.html; Supplier: LCSC; Tolerance: ±10%; Voltage Rating: 50V; Temperature Coefficient: X7R; H7MS_Function: C_RESET_U
C403 = C1005X7R1H104K050BB: 容值:100nF;精度:±10%;额定电压:50V;温度系数:X7R;; LCSC Part Name: 100nF ±10% 50V; Supplier Part: C2181015; Manufacturer: TDK; Supplier Footprint: 0402; JLCPCB Part Class: Extended Part; Datasheet: https://item.szlcsc.com/datasheet/C1005X7R1H104K050BB/2273082.html; Supplier: LCSC; Tolerance: ±10%; Voltage Rating: 50V; Temperature Coefficient: X7R; H7MS_Function: C_NRST
J401 = FTSH-105-01-L-DV-007-K: 插针结构:2x5P;间距:1.27mm;圆针/方针:方针;安装方式:立贴;排数:双排;总PIN位数:10P;额定电流:3.4A;配合针长度:3.05mm;端接针长度:-;触头材质:磷青铜;触头镀层:金;工作温度:-55℃~+125℃;颜色:黑色;; LCSC Part Name: 2x5P 间距:1.27mm 方针 立贴; Supplier Part: C5296739; Manufacturer: SAMTEC; Supplier Footprint: SMD,P=1.27mm; JLCPCB Part Class: Extended Part; Datasheet: https://item.szlcsc.com/datasheet/FTSH-105-01-L-DV-007-K/6042691.html; Supplier: LCSC; Pin Structure: 2x5P; Pitch: 1.27mm; Circluar Pins/Square Pins: 方针; Mounting Type: 立贴; Number of Rows: 双排; Number of Pins: 10P; Current Rating: 3.4A; Length of Mating Pin: 3.05mm; Contact Material: 磷青铜; Contact Plating: 金; Operating Temperature: -55℃~+125℃; Color: 黑色; H7MS_Function: J_SWD
R401 = RC0402FR-0722RL: 电阻类型:厚膜电阻;阻值:22Ω;精度:±1%;功率:62.5mW;最大工作电压:50V;温度系数:±100ppm/℃;; LCSC Part Name: 厚膜电阻 22Ω ±1% 62.5mW; Supplier Part: C114765; Manufacturer: YAGEO(国巨); Supplier Footprint: 0402; JLCPCB Part Class: Extended Part; Datasheet: https://atta.szlcsc.com/upload/public/pdf/source/20180821/C275644_0D56F95EFF785E7D9A1FEF436B37DA78.pdf; Supplier: LCSC; Type: 厚膜电阻; Tolerance: ±1%; Power(Watts): 62.5mW; Overload Voltage (Max): 50V; Temperature Coefficient: ±100ppm/℃; Operating Temperature Range: -55℃~+155℃; H7MS_Function: R_HSE
R402 = RC0402FR-0710KL: 电阻类型:厚膜电阻;阻值:10kΩ;精度:±1%;功率:62.5mW;工作电压:50V;温度系数:±100ppm/℃;; LCSC Part Name: 厚膜电阻 10kΩ ±1% 62.5mW; Supplier Part: C60490; Manufacturer: YAGEO(国巨); Supplier Footprint: 0402; JLCPCB Part Class: Extended Part; Datasheet: https://item.szlcsc.com/datasheet/RC0402FR-0710KL/61542.html; Supplier: LCSC; Type: 厚膜电阻; Tolerance: ±1%; Power(Watts): 62.5mW; Voltage-Supply(Max): 50V; Temperature Coefficient: ±100ppm/℃; Operating Temperature: -55℃~+155℃; H7MS_Function: R_MR
R403 = RC0402FR-0710KL: 电阻类型:厚膜电阻;阻值:10kΩ;精度:±1%;功率:62.5mW;工作电压:50V;温度系数:±100ppm/℃;; LCSC Part Name: 厚膜电阻 10kΩ ±1% 62.5mW; Supplier Part: C60490; Manufacturer: YAGEO(国巨); Supplier Footprint: 0402; JLCPCB Part Class: Extended Part; Datasheet: https://item.szlcsc.com/datasheet/RC0402FR-0710KL/61542.html; Supplier: LCSC; Type: 厚膜电阻; Tolerance: ±1%; Power(Watts): 62.5mW; Voltage-Supply(Max): 50V; Temperature Coefficient: ±100ppm/℃; Operating Temperature: -55℃~+155℃; H7MS_Function: R_NRST
R404 = RC0402FR-0710KL: 电阻类型:厚膜电阻;阻值:10kΩ;精度:±1%;功率:62.5mW;工作电压:50V;温度系数:±100ppm/℃;; LCSC Part Name: 厚膜电阻 10kΩ ±1% 62.5mW; Supplier Part: C60490; Manufacturer: YAGEO(国巨); Supplier Footprint: 0402; JLCPCB Part Class: Extended Part; Datasheet: https://item.szlcsc.com/datasheet/RC0402FR-0710KL/61542.html; Supplier: LCSC; Type: 厚膜电阻; Tolerance: ±1%; Power(Watts): 62.5mW; Voltage-Supply(Max): 50V; Temperature Coefficient: ±100ppm/℃; Operating Temperature: -55℃~+155℃; H7MS_Function: R_BOOT
SW401 = H7MS_EVQP7A01P_1234_Inward: Corrected numeric contact aliases; inward pin graphics.; Manufacturer: PANASONIC(松下); Supplier: LCSC; Supplier Part: C79167; LCSC Part Name: 3.5*3.55*1.35mm 卧贴 轻触开关; Supplier Footprint: SMD,3.5x3.6mm; JLCPCB Part Class: Extended Part; Datasheet: https://item.szlcsc.com/datasheet/EVQP7A01P/80304.html; Circuit: 单刀单掷; Actuator Style: 矩形按钮; Operating Force: 2.2N; Mounting Type: 卧贴; Length: 3.5mm; Width: 3.55mm; Switch Height: 1.35mm; Contact Current: 50mA; Voltage Rating: 12V; Termination Style: 焊片; Life: 10万次; Operating Temperature: -20℃~+70℃; H7MS_Function: SW_RESET
SW402 = H7MS_EVQP7A01P_1234_Inward: Corrected numeric contact aliases; inward pin graphics.; Manufacturer: PANASONIC(松下); Supplier: LCSC; Supplier Part: C79167; LCSC Part Name: 3.5*3.55*1.35mm 卧贴 轻触开关; Supplier Footprint: SMD,3.5x3.6mm; JLCPCB Part Class: Extended Part; Datasheet: https://item.szlcsc.com/datasheet/EVQP7A01P/80304.html; Circuit: 单刀单掷; Actuator Style: 矩形按钮; Operating Force: 2.2N; Mounting Type: 卧贴; Length: 3.5mm; Width: 3.55mm; Switch Height: 1.35mm; Contact Current: 50mA; Voltage Rating: 12V; Termination Style: 焊片; Life: 10万次; Operating Temperature: -20℃~+70℃; H7MS_Function: SW_BOOT
U401 = TPS3808G33DBVR: 工作电压:1.7V~6.5V;复位有效电平:低电平有效;受监控电压数:1;复位超时:20ms;; LCSC Part Name: 低静态电流、可编程延迟监控电路; Supplier Part: C43698; Manufacturer: TI(德州仪器); Supplier Footprint: SOT-23-6; JLCPCB Part Class: Extended Part; Datasheet: https://www.ti.com/cn/lit/ds/symlink/tps3808.pdf; Supplier: LCSC; ChipType: 电压监控器; Output Type: 开漏; Voltage - Supply: 1.7V~6.5V; Reset Active Level: 低电平有效; Threshold Voltage: 3.07V; Number of Voltages Monitored: 1; Reset Timeout: 20ms; Operating Temperature: -40℃~+125℃; Function: 手动复位输入; Quiescent Current: 2.4uA; H7MS_Function: U_RESET
Y401 = X1G0041710015: 特性：标准频率：20种。 供电电压：1.8 V至3.3 V（典型值）。 功能：待机（ST）。 工作温度：-40℃至+105℃ 型号别名:SG-210STF 8.0000ML; LCSC Part Name: SG-210STF 8.000000MHz  1.6V~3.6V -40~+85℃; Supplier Part: C256004; Manufacturer: EPSON(爱普生); Supplier Footprint: SMD2520-4P; JLCPCB Part Class: Extended Part; Datasheet: https://item.szlcsc.com/datasheet/X1G0041710015/249769.html; Supplier: LCSC; H7MS_Function: Y1

## Nets
3V3_A: C212.1 C213.1 C214.1 C215.1 R201.2 U101.H1(VDDA) U101.J1(VREF+) ; also on sheet 5 8
3V3_AUX: C312.1 C313.1 U302.6(OUT) ; also on sheet 8
3V3_D: C201.1 C202.1 C208.1 C209.1 C210.1 C211.1 C216.1 C217.1 C218.1 C219.1 C305.1 C306.1 C307.1 C308.1 C310.1 C311.1 C401.1 C402.1 J401.1 L301.2 R201.1 R301.2 R302.2 R304.2 R305.1 R402.2 R403.2 SW402.2 SW402.4 U101.C2(VBAT) U101.D3(PDR_ON) U101.D6(VDD) U101.E1(VDDSMPS) U101.E5(VDD) U101.E8(VDD33USB) U101.F6(VDD) U301.14(VOS) U302.1(IN) U401.5(SENSE) U401.6(VDD) Y401.1(OE/NC) Y401.4(VDD) ; also on sheet 5 6 7 8
5V_IN: C301.1 C302.1 C303.1 C304.1 U301.10(AVIN) U301.11(PVIN) U301.12(PVIN) U301.13(EN) ; also on sheet 5 6 8
GND: C201.2 C202.2 C203.2 C204.2 C205.2 C206.2 C207.2 C208.2 C209.2 C210.2 C211.2 C212.2 C213.2 C214.2 C215.2 C216.2 C217.2 C218.2 C219.2 C301.2 C302.2 C303.2 C304.2 C305.2 C306.2 C307.2 C308.2 C309.2 C310.2 C311.2 C312.2 C313.2 C401.2 C402.2 C403.2 J401.3 J401.5 J401.9 R303.2 R306.2 R404.2 SW301.2 SW301.4 SW401.2 SW401.4 U101.C1(VSS) U101.D1(VSSSMPS) U101.D5(VSS) U101.E7(VSS) U101.F5(VSS) U101.H2(VSSA) U301.6(AGND) U301.7(FSW) U301.8(DEF) U301.15(PGND) U301.16(PGND) U301.17(PAD) U302.2(GND) U401.2(GND) Y401.2(GND) ; also on sheet 5 6 7 8
VBUS_PRESENT: U101.E9(PA9) ; also on sheet 7
AUX_EN: R302.1 SW301.1 SW301.3 U302.3(EN)
AUX_FAULT_N: R304.1 U302.4(FAULT#) ; also on sheet 8
AUX_ILIM: R303.1 U302.5(ILIM)
BOOT0: R404.1 SW402.1 SW402.3 U101.A5(BOOT0) ; also on sheet 8
BUCK_FB: R305.2 R306.1 U301.5(FB)
BUCK_PG: R301.1 U301.4(PG) ; also on sheet 8
BUCK_SS: C309.1 U301.9(SS/TR)
BUCK_SW: L301.1 U301.1(SW) U301.2(SW) U301.3(SW)
CAN1_RX: U101.A4(PB8) ; also on sheet 6
CAN1_STB: U101.A8(PD3) ; also on sheet 6
CAN1_TX: U101.E3(PB9) ; also on sheet 6
CAN2_RX: U101.A6(PB5) ; also on sheet 6
CAN2_STB: U101.B7(PD4) ; also on sheet 6
CAN2_TX: U101.D4(PB6) ; also on sheet 6
CAN3_RX: U101.H9(PD12) ; also on sheet 6
CAN3_STB: U101.C6(PD7) ; also on sheet 6
CAN3_TX: U101.H10(PD13) ; also on sheet 6
EXP_PA0: U101.G3(PA0) ; also on sheet 8
EXP_PA1: U101.J2(PA1) ; also on sheet 8
EXP_PA2: U101.H3(PA2) ; also on sheet 8
EXP_PA3: U101.G5(PA3) ; also on sheet 8
EXP_PA4: U101.K1(PA4) ; also on sheet 8
EXP_PA5: U101.K2(PA5) ; also on sheet 8
EXP_PA6: U101.J3(PA6) ; also on sheet 8
EXP_PA7: U101.K3(PA7) ; also on sheet 8
EXP_PA8: U101.F10(PA8) ; also on sheet 8
EXP_PA10: U101.E10(PA10) ; also on sheet 8
EXP_PA15: U101.C8(PA15) ; also on sheet 8
EXP_PB0: U101.K4(PB0) ; also on sheet 8
EXP_PB1: U101.K5(PB1) ; also on sheet 8
EXP_PB2: U101.J5(PB2) ; also on sheet 8
EXP_PB3: U101.B6(PB3) ; also on sheet 8
EXP_PB4: U101.C5(PB4) ; also on sheet 8
EXP_PB7: U101.B5(PB7) ; also on sheet 8
EXP_PB10: U101.K7(PB10) ; also on sheet 8
EXP_PB11: U101.J7(PB11) ; also on sheet 8
EXP_PB12: U101.K8(PB12) ; also on sheet 8
EXP_PB13: U101.J8(PB13) ; also on sheet 8
EXP_PB14: U101.K9(PB14) ; also on sheet 8
EXP_PB15: U101.K10(PB15) ; also on sheet 8
EXP_PC0: U101.F3(PC0) ; also on sheet 8
EXP_PC1: U101.F1(PC1) ; also on sheet 8
EXP_PC4: U101.H4(PC4) ; also on sheet 8
EXP_PC5: U101.J4(PC5) ; also on sheet 8
EXP_PC6: U101.F8(PC6) ; also on sheet 8
EXP_PC7: U101.G9(PC7) ; also on sheet 8
EXP_PC8: U101.G10(PC8) ; also on sheet 8
EXP_PC9: U101.F9(PC9) ; also on sheet 8
EXP_PC10: U101.B10(PC10) ; also on sheet 8
EXP_PC11: U101.B9(PC11) ; also on sheet 8
EXP_PC12: U101.A10(PC12) ; also on sheet 8
EXP_PD0: U101.C7(PD0) ; also on sheet 8
EXP_PD1: U101.B8(PD1) ; also on sheet 8
EXP_PD2: U101.A9(PD2) ; also on sheet 8
EXP_PD5: U101.D7(PD5) ; also on sheet 8
EXP_PD6: U101.A7(PD6) ; also on sheet 8
EXP_PD8: U101.J9(PD8) ; also on sheet 8
EXP_PD9: U101.H8(PD9) ; also on sheet 8
EXP_PD11: U101.H7(PD11) ; also on sheet 8
EXP_PD14: U101.G7(PD14) ; also on sheet 8
EXP_PD15: U101.G8(PD15) ; also on sheet 8
EXP_PE0: U101.B4(PE0) ; also on sheet 8
EXP_PE1: U101.C4(PE1) ; also on sheet 8
EXP_PE7: U101.H5(PE7) ; also on sheet 8
EXP_PE8: U101.J6(PE8) ; also on sheet 8
EXP_PE10: U101.H6(PE10) ; also on sheet 8
HSE_IN: R401.2 U101.G1(PH0-OSC_IN)
HSE_OUT: R401.1 Y401.3(OUT)
HSE_RESERVED: U101.G2(PH1-OSC_OUT)
IMU_ACC_CS: U101.B3(PE3) ; also on sheet 5
IMU_ACC_IRQ: U101.E4(PC13) ; also on sheet 5
IMU_GYRO_CS: U101.C3(PE4) ; also on sheet 5
IMU_GYRO_IRQ: U101.J10(PD10) ; also on sheet 5
IMU_HEATER_NTC: U101.G4(PC3_C) ; also on sheet 5
IMU_HEATER_PWM: U101.K6(PE9) ; also on sheet 5
IMU_MISO: U101.A2(PE5) ; also on sheet 5
IMU_MOSI: U101.A1(PE6) ; also on sheet 5
IMU_SCK: U101.A3(PE2) ; also on sheet 5
LOCAL_5V_ADC: U101.F4(PC2_C) ; also on sheet 5
LSE_IN: U101.B1(PC14-OSC32_IN)
LSE_OUT: U101.B2(PC15-OSC32_OUT)
MR_N: R402.1 SW401.1 SW401.3 U401.3(MR#)
NRST: C403.1 J401.10 R403.1 U101.F2(NRST) U401.1(RESET#) ; also on sheet 5 8
SMPS_SW: C203.1 L201.1 U101.D2(VLXSMPS)
SWCLK: J401.4 U101.C9(PA14)
SWDIO: J401.2 U101.C10(PA13)
USB_DM: U101.D10(PA11) ; also on sheet 7
USB_DP: U101.D9(PA12) ; also on sheet 7
VCORE: C204.1 C205.1 C206.1 C207.1 L201.2 U101.D8(VCAP) U101.E2(VFBSMPS) U101.E6(VDDLDO) U101.F7(VDDLDO) U101.G6(VCAP) ; also on sheet 8

Not connected (* = marked no-connect by the designer): J401 6* 8*; U401 4(CT)*
